# Altium schematic sheet M2_KEY_M.SchDoc
size 297 x 209 mm
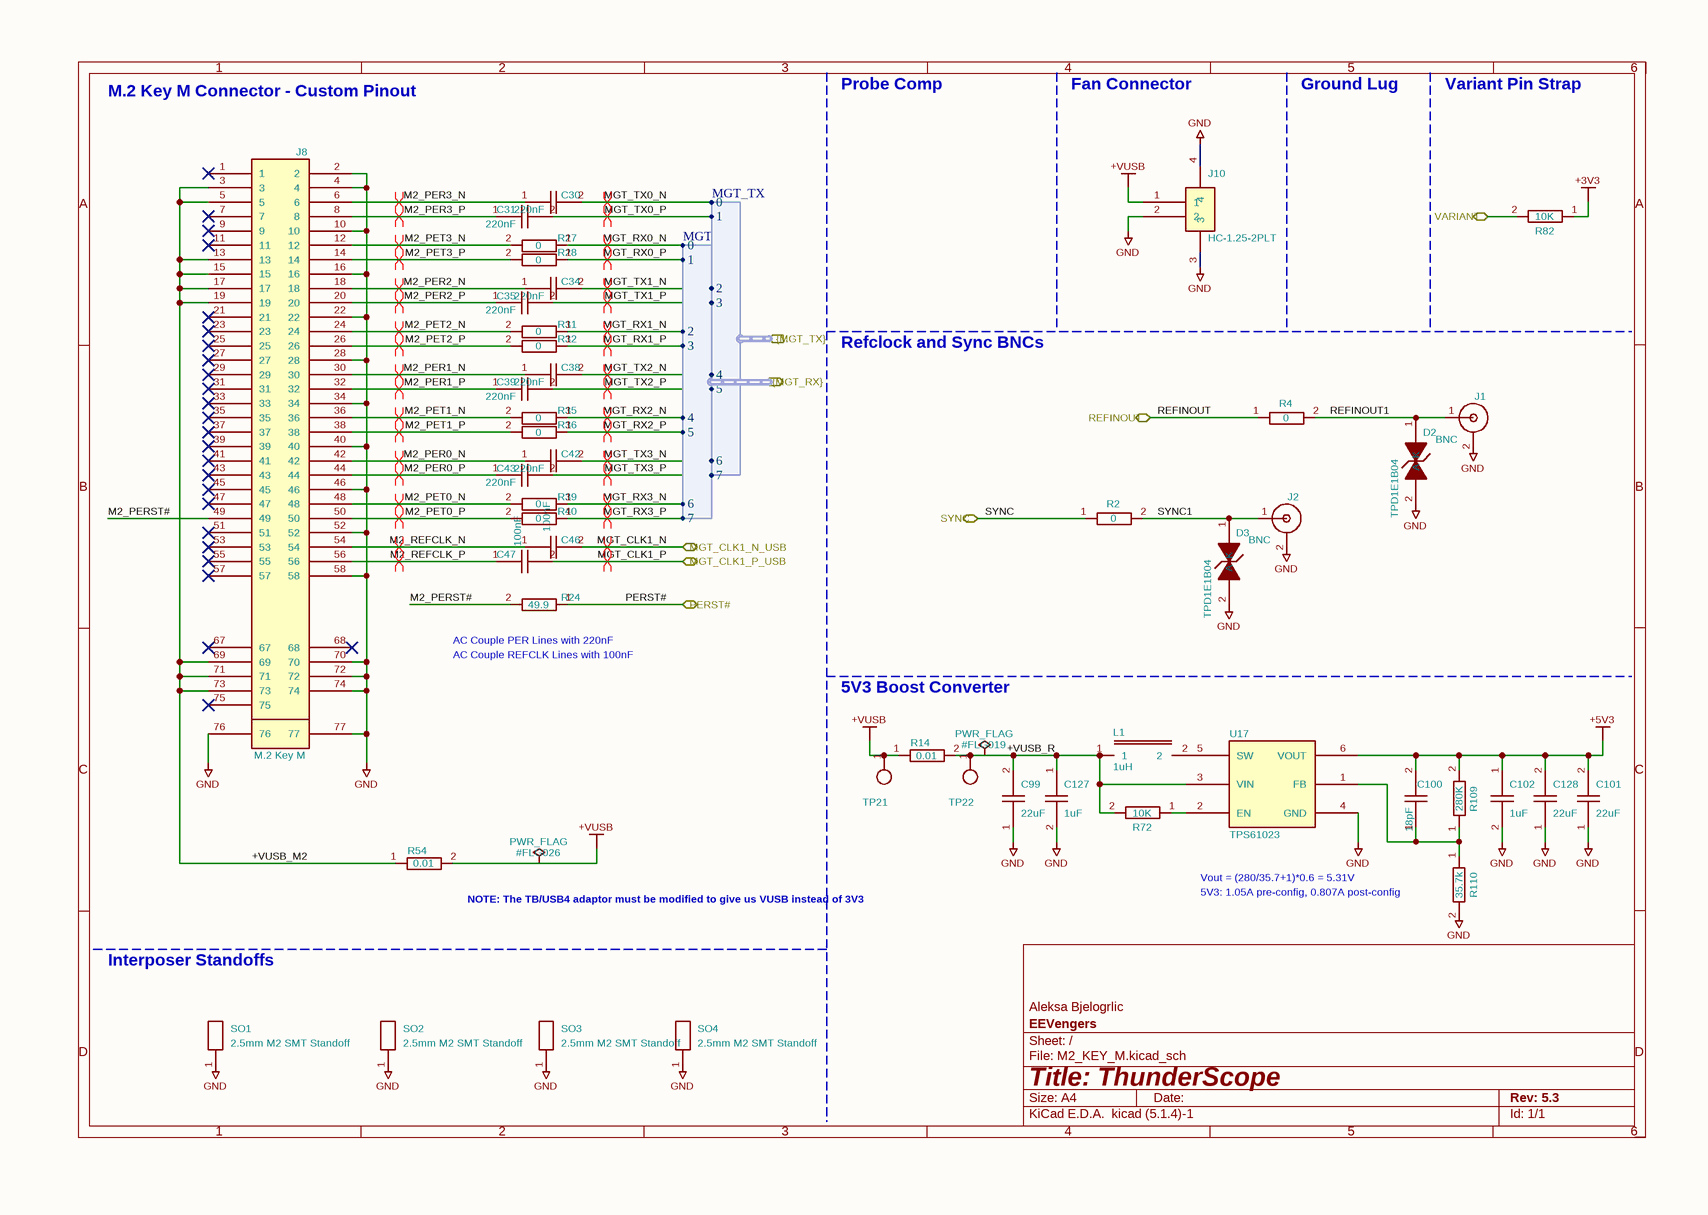
[diagram p0: M2_KEY_M.SchDoc]

## Parts
#FLG019  PWR_FLAG  (graphical)
#FLG026  PWR_FLAG  (graphical)
C30  220nF  [GEN_C_0402]
C31  220nF  [GEN_C_0402]
C34  220nF  [GEN_C_0402]
C35  220nF  [GEN_C_0402]
C38  220nF  [GEN_C_0402]
C39  220nF  [GEN_C_0402]
C42  220nF  [GEN_C_0402]
C43  220nF  [GEN_C_0402]
C46  100nF  [GEN_C_0402]
C47  100nF  [GEN_C_0402]
C99  22uF  [GEN_C_0805]
C100  18pF  [GEN_C_0402]
C101  22uF  [GEN_C_0805]
C102  1uF  [GEN_C_0402]
C127  1uF  [GEN_C_0402]
C128  22uF  [GEN_C_0805]
D2  TPD1E1B04  [TI_X1SON_DPY0002A]
D3  TPD1E1B04  [TI_X1SON_DPY0002A]
J1  BNC  [DOSIN-801-0072]
J2  BNC  [DOSIN-801-0072]
J8  M.2 Key M  [TE_M2_KEYM_2199230]
J10  HC-1.25-2PLT  [CONN-SMD_HC-1.25-2PLT]
L1  1uH  [GEN_L_1210]
R2  0  [GEN_R_0402]
R4  0  [GEN_R_0402]
R14  0.01  [GEN_R_0603]
R24  49.9  [GEN_R_0402]
R27  0  [GEN_R_0402]
R28  0  [GEN_R_0402]
R31  0  [GEN_R_0402]
R32  0  [GEN_R_0402]
R35  0  [GEN_R_0402]
R36  0  [GEN_R_0402]
R39  0  [GEN_R_0402]
R40  0  [GEN_R_0402]
R54  0.01  [GEN_R_0603]
R72  10K  [GEN_R_0402]
R82  10K  [GEN_R_0402]
R109  280K  [GEN_R_0402]
R110  35.7k  [GEN_R_0402]
SO1  2.5mm M2 SMT Standoff  [STANDOFF_M2_9774025243R]
SO2  2.5mm M2 SMT Standoff  [STANDOFF_M2_9774025243R]
SO3  2.5mm M2 SMT Standoff  [STANDOFF_M2_9774025243R]
SO4  2.5mm M2 SMT Standoff  [STANDOFF_M2_9774025243R]
TP21  PCB  [GEN_TP_PCB]  (value not drawn)
TP22  PCB  [GEN_TP_PCB]  (value not drawn)
U17  TPS61023  [TI_SOT563_DRL0006A]

## Ports
MGT_CLK1_N_USB (bidir), MGT_CLK1_P_USB (bidir), PERST# (bidir), REFINOUT (bidir), SYNC (bidir), VARIANT (bidir), {MGT_RX} (out, harness MGT_RX), {MGT_TX} (in, harness MGT_TX)

## Harnesses
MGT_RX: 0, 1, 2, 3, 4, 5, 6, 7
MGT_TX: 0, 1, 2, 3, 4, 5, 6, 7

## Nets
+3V3: R82.1
+5V3: C100.2 C101.2 C102.1 C128.2 R109.2 U17.6(VOUT)
+VUSB: #FLG026.1 J10.1 R14.1 R54.2 TP21.1
GND: C99.1 C101.1 C102.2 C127.2 C128.1 D2.2(A) D3.2(A) J1.2(SHIELD) J2.2(SHIELD) J8.2 J8.4 J8.10 J8.16 J8.22 J8.28 J8.34 J8.40 J8.46 J8.52 J8.58 J8.70 J8.72 J8.74 J8.76 J8.77 J10.2 J10.3 J10.4 R110.2 SO1.1 SO2.1 SO3.1 SO4.1 U17.4(GND)
+VUSB_M2: J8.3 J8.5 J8.13 J8.15 J8.17 J8.19 J8.69 J8.71 J8.73 R54.1
+VUSB_R: #FLG019.1 C99.2 C127.1 L1.1 R14.2 R72.2 TP22.1 U17.3(VIN)
M2_PER0_N: C42.1 J8.42
M2_PER0_P: C43.1 J8.44
M2_PER1_N: C38.1 J8.30
M2_PER1_P: C39.1 J8.32
M2_PER2_N: C34.1 J8.18
M2_PER2_P: C35.1 J8.20
M2_PER3_N: C30.1 J8.6
M2_PER3_P: C31.1 J8.8
M2_PERST#: J8.49 R24.2
M2_PET0_N: J8.48 R39.2
M2_PET0_P: J8.50 R40.2
M2_PET1_N: J8.36 R35.2
M2_PET1_P: J8.38 R36.2
M2_PET2_N: J8.24 R31.2
M2_PET2_P: J8.26 R32.2
M2_PET3_N: J8.12 R27.2
M2_PET3_P: J8.14 R28.2
M2_REFCLK_N: C46.1 J8.54
M2_REFCLK_P: C47.1 J8.56
MGT_CLK1_N: C46.2 ; port MGT_CLK1_N_USB
MGT_CLK1_P: C47.2 ; port MGT_CLK1_P_USB
MGT_RX0_N: R27.1 ; port {MGT_RX}.0
MGT_RX0_P: R28.1 ; port {MGT_RX}.1
MGT_RX1_N: R31.1 ; port {MGT_RX}.2
MGT_RX1_P: R32.1 ; port {MGT_RX}.3
MGT_RX2_N: R35.1 ; port {MGT_RX}.4
MGT_RX2_P: R36.1 ; port {MGT_RX}.5
MGT_RX3_N: R39.1 ; port {MGT_RX}.6
MGT_RX3_P: R40.1 ; port {MGT_RX}.7
MGT_TX0_N: C30.2 ; port {MGT_TX}.0
MGT_TX0_P: C31.2 ; port {MGT_TX}.1
MGT_TX1_N: C34.2 ; port {MGT_TX}.2
MGT_TX1_P: C35.2 ; port {MGT_TX}.3
MGT_TX2_N: C38.2 ; port {MGT_TX}.4
MGT_TX2_P: C39.2 ; port {MGT_TX}.5
MGT_TX3_N: C42.2 ; port {MGT_TX}.6
MGT_TX3_P: C43.2 ; port {MGT_TX}.7
PERST#: R24.1 ; port PERST#
REFINOUT: R4.1 ; port REFINOUT
REFINOUT1: D2.1(K) J1.1(Signal) R4.2
SYNC: R2.1 ; port SYNC
SYNC1: D3.1(K) J2.1(Signal) R2.2
VARIANT: R82.2 ; port VARIANT
NetC100_1: C100.1 R109.1 R110.1 U17.1(FB)
NetL1_2: L1.2 U17.5(SW)
NetR72_1: R72.1 U17.2(EN)

Not connected (* = marked no-connect by the designer): J8 1* 7* 9* 11* 21* 23* 25* 27* 29* 31* 33* 35* 37* 39* 41* 43* 45* 47* 51* 53* 55* 57* 67* 68* 75*

## Layout directives
differential pair; differential pair class PCIe: M2_PER0_N, M2_PER0_P, M2_PER1_N, M2_PER1_P, M2_PER2_N, M2_PER2_P, M2_PER3_N, M2_PER3_P, M2_PET0_N, M2_PET0_P, M2_PET1_N, M2_PET1_P, M2_PET2_N, M2_PET2_P, M2_PET3_N, M2_PET3_P, M2_REFCLK_N, M2_REFCLK_P, MGT_CLK1_N, MGT_CLK1_P, MGT_RX0_N, MGT_RX0_P, MGT_RX1_N, MGT_RX1_P, MGT_RX2_N, MGT_RX2_P, MGT_RX3_N, MGT_RX3_P, MGT_TX0_N, MGT_TX0_P, MGT_TX1_N, MGT_TX1_P, MGT_TX2_N, MGT_TX2_P, MGT_TX3_N, MGT_TX3_P

## Notes on the sheet
- M.2 Key M Connector - Custom Pinout
- Probe Comp
- Fan Connector
- Ground Lug
- Variant Pin Strap
- Refclock and Sync BNCs
- (near R24) AC Couple PER Lines with 220nF
- (near R24) AC Couple REFCLK Lines with 100nF
- 5V3 Boost Converter
- NOTE: The TB/USB4 adaptor must be modified to give us VUSB instead of 3V3
- Vout = (280/35.7+1)*0.6 = 5.31V
- (near R110) 5V3: 1.05A pre-config, 0.807A post-config
- Interposer Standoffs
- 1
- 2
- 3
- 4
- 5
- 6
- A
- B
- C
- Aleksa Bjelogrlic
- D
- Title: ThunderScope
- File: M2_KEY_M.kicad_sch
- Sheet: /
- EEVengers
- KiCad E.D.A.  kicad (5.1.4)-1
- Size: A4
- Date:
- Rev: 5.3
- Id: 1/1

## Library data of the parts
C30 C31 C34 C35 C38 C39 C42 C43 = CAP 220nF 16V X7R 0402: HOUSE PART NUMBER: C-100nF-0402-002; MANUFACTURER: Murata; MANUFACTURER PART NUMBER: GCM155R71C224KE02D; VOLTAGE RATING: 16V; Substitutions Policy: Any Parametric Equivalent; PACKAGE: 0402; SUPPLIER 1: Mouser; SUPPLIER PART NUMBER 1: 81-GCM155R71C224KE2D; Footprint: Thunderscope_Rev5:GEN_C_0402; Value: 220nF
C46 C47 = CAP 100nF 16V X7R 0402: HOUSE PART NUMBER: C-100nF-0402-002; MANUFACTURER: Murata; MANUFACTURER PART NUMBER: GCM155R71C104KA55D; VOLTAGE RATING: 16V; Substitutions Policy: Any Parametric Equivalent; PACKAGE: 0402; SUPPLIER 1: Mouser; SUPPLIER PART NUMBER 1: 81-GCM155R71C104KA5D; Footprint: Thunderscope_Rev5:GEN_C_0402; Value: 100nF
C99 C101 C128 = CAP 22uF 25V X5R 0805: HOUSE PART NUMBER: C-22uF-0805-002; MANUFACTURER: Murata; MANUFACTURER PART NUMBER: GRM21BR61E226ME44L; VOLTAGE RATING: 25V; Substitutions Policy: Any Parametric Equivalent; PACKAGE: 0805; SUPPLIER 1: Mouser; SUPPLIER PART NUMBER 1: 81-GRM21BR61E226ME4L; Footprint: Thunderscope_Rev5:GEN_C_0805; Value: 22uF
C100 = CAP 18pF 50V C0G 0402: MANUFACTURER: KEMET; MANUFACTURER PART NUMBER: CBR04C180F5GAC; VOLTAGE RATING: 50V; TEMPERATURE COEFFICIENT: C0G; Substitutions Policy: No Substitutions; PACKAGE: 0402; SUPPLIER 1: Mouser; SUPPLIER PART NUMBER 1: 80-CBR04C180F5G; Footprint: Thunderscope_Rev5:GEN_C_0402; Value: 18pF
C102 C127 = CAP 1uF 25V X5R 0402: MANUFACTURER: Murata; MANUFACTURER PART NUMBER: GRM155R61E105KA12D; VOLTAGE RATING: 25V; Substitutions Policy: Any Parametric Equivalent; PACKAGE: 0402; SUPPLIER 1: Mouser; SUPPLIER PART NUMBER 1: 81-GRM155R61E105KA2D; Footprint: Thunderscope_Rev5:GEN_C_0402; Value: 1uF
D2 D3 = TVS TPD1E1B04: MANUFACTURER: Texas Instruments; MANUFACTURER PART NUMBER: TPD1E1B04DPYR; Substitutions Policy: No Substitutions; SUPPLIER 1: Texas Instruments; SUPPLIER PART NUMBER 1: TPD1E1B04DPYR; PACKAGE: 2-X1SON (1x0.6mm); Footprint: Thunderscope_Rev5:TI_X1SON_DPY0002A; Value: TPD1E1B04
J1 J2 = BNC JACK R/A: MANUFACTURER: Molex; MANUFACTURER PART NUMBER: 73100-0105; Substitutions Policy: No Substitutions; SUPPLIER 1: Mouser; SUPPLIER PART NUMBER 1: 538-73100-0105; PACKAGE: Through Hole; Footprint: Thunderscope_Rev5:MOL_0731000105; Value: BNC
J8 = CONN M.2 Key M FEMALE: MANUFACTURER: TE Connectivity; MANUFACTURER PART NUMBER: 1-2199230-5; Substitutions Policy: No Substitutions; SUPPLIER 1: Mouser; SUPPLIER PART NUMBER 1: 571-1-2199230-5; PACKAGE: Surface Mount; Footprint: Thunderscope_Rev5:TE_M2_KEYM_2199230; Value: M.2 Key M
J10 = CONN 1.27mm 2PIN: MANUFACTURER: KYOCERA AVX; MANUFACTURER PART NUMBER: 009155002852006; Substitutions Policy: No Substitutions; SUPPLIER 1: Mouser; SUPPLIER PART NUMBER 1: 581-009155002852006; PACKAGE: Surface Mount; Footprint: Thunderscope_Rev5:KYO_009155002852006; Value: HC-1.25-2PLT
L1 = IND 1uH 5.5A 32 MOHM 1210: HOUSE PART NUMBER: SRP3212-1R0M; MANUFACTURER: Bourns; Substitutions Policy: ECO Required for Substitution; SUPPLIER 1: Mouser; SUPPLIER PART NUMBER 1: 652-SRP3212-1R0M; MANUFACTURER PART NUMBER: SRP3212-1R0M; PACKAGE: 1210; Value: 1uH; Footprint: Thunderscope_Rev5:GEN_L_1210
R2 R4 R27 R28 R31 R32 R35 R36 R39 R40 = RES 0 OHM 1/16W 0402: MANUFACTURER: Yageo; MANUFACTURER PART NUMBER: RC0402JR-070RL; Substitutions Policy: Any Parametric Equivalent; PACKAGE: 0402; SUPPLIER 1: Mouser; SUPPLIER PART NUMBER 1: 603-RC0402JR-070RL; Footprint: Thunderscope_Rev5:GEN_R_0402; Value: 0
R14 R54 = RES 0.01 OHM 1% 1/4W 0603: HOUSE PART NUMBER: R-0.01-0603-1%-001; MANUFACTURER: Susumu; MANUFACTURER PART NUMBER: RL0816T-R010-F; TOLERANCE: 1%; Substitutions Policy: Any Parametric Equivalent; SUPPLIER 1: Mouser; SUPPLIER PART NUMBER 1: 754-RL0816T-R010-F; PACKAGE: 0603; Footprint: Thunderscope_Rev5:GEN_R_0603; Value: 0.01
R24 = RES 49.9 OHM 1% 1/10W 0402: MANUFACTURER: Yageo; MANUFACTURER PART NUMBER: RC0402FR-0749R9L; TOLERANCE: 1%; Substitutions Policy: Any Parametric Equivalent; PACKAGE: 0402; SUPPLIER 1: Mouser; SUPPLIER PART NUMBER 1: 603-RC0402FR-0749R9L; Footprint: Thunderscope_Rev5:GEN_R_0402; Value: 49.9
R72 R82 = RES 10K OHM 1% 1/16W 0402: MANUFACTURER: Yageo; MANUFACTURER PART NUMBER: RC0402FR-0710KL; TOLERANCE: 1%; Substitutions Policy: Any Parametric Equivalent; PACKAGE: 0402; SUPPLIER 1: Mouser; SUPPLIER PART NUMBER 1: 603-RC0402FR-0710KL; Footprint: Thunderscope_Rev5:GEN_R_0402; Value: 10K
R109 = RES 280K OHM 1% 1/16W 0402: MANUFACTURER: Yageo; MANUFACTURER PART NUMBER: RC0402FR-07280KL; TOLERANCE: 1%; Substitutions Policy: Any Parametric Equivalent; PACKAGE: 0402; SUPPLIER 1: Mouser; SUPPLIER PART NUMBER 1: 603-RC0402FR-07280KL; Footprint: Thunderscope_Rev5:GEN_R_0402; Value: 280K
R110 = RES 35.7K OHM 1% 1/16W 0402: MANUFACTURER: Yageo; MANUFACTURER PART NUMBER: RC0402FR-0735K7L; TOLERANCE: 1%; Substitutions Policy: Any Parametric Equivalent; PACKAGE: 0402; SUPPLIER 1: Mouser; SUPPLIER PART NUMBER 1: 603-RC0402FR-0735K7L; Footprint: Thunderscope_Rev5:GEN_R_0402; Value: 35.7k
SO1-SO4 = STANDOFF_M2_9774025243R: MANUFACTURER: Wurth Elektronik; Substitutions Policy: No Substitutions; SUPPLIER 1: Mouser; SUPPLIER PART NUMBER 1: 710-9774025243R; MANUFACTURER PART NUMBER: 9774025243R; PACKAGE: Surface Mount; Footprint: Thunderscope_Rev5:STANDOFF_M2_9774025243R; Value: 2.5mm M2 SMT Standoff
TP21 TP22 = TP PCB 1mm: Footprint: Thunderscope_Rev5:GEN_TP_PCB; Value: PCB
U17 = IC BOOST TPS61023: MANUFACTURER: Texas Instruments; MANUFACTURER PART NUMBER: TPS61023DRLT; Substitutions Policy: No Substitutions; SUPPLIER 1: Texas Instruments; SUPPLIER PART NUMBER 1: TPS61023DRLT; PACKAGE: SOT-563; Footprint: Thunderscope_Rev5:TI_SOT563_DRL0006A; Value: TPS61023
#FLG019 #FLG026 = PWR_FLAG: Value: PWR_FLAG